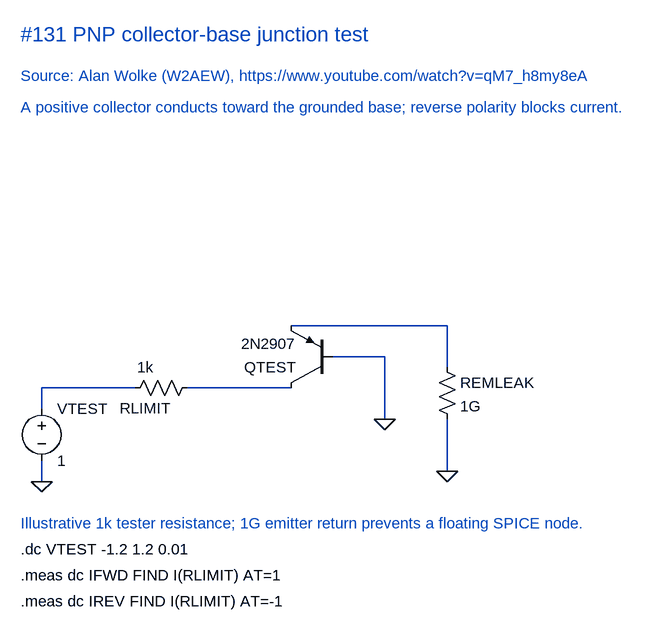
[diagram p0: schematic PNP base-collector test.asc]
PNP base-collector test.asc, the LTspice schematic file:
Version 4.1
SHEET 1 1088 960
WIRE 720 480 480 480
WIRE 624 528 544 528
WIRE 720 544 720 480
WIRE 240 576 96 576
WIRE 480 576 320 576
WIRE 96 608 96 576
WIRE 624 624 624 528
WIRE 720 704 720 624
WIRE 96 720 96 688
FLAG 96 720 0
FLAG 624 624 0
FLAG 720 704 0
SYMBOL voltage 96 592 R0
SYMATTR InstName VTEST
SYMATTR Value 1
SYMBOL res 224 592 R270
WINDOW 0 0 32 VBottom 2
WINDOW 3 32 32 VTop 2
SYMATTR InstName RLIMIT
SYMATTR Value 1k
SYMBOL pnp 544 576 R180
SYMATTR InstName QTEST
SYMATTR Value 2N2907
SYMBOL res 704 528 R0
SYMATTR InstName REMLEAK
SYMATTR Value 1G
TEXT 64 32 Left 3 ;#131 PNP collector-base junction test
TEXT 64 96 Left 2 ;Source: Alan Wolke (W2AEW), https://www.youtube.com/watch?v=qM7_h8my8eA
TEXT 64 144 Left 2 ;A positive collector conducts toward the grounded base; reverse polarity blocks current.
TEXT 64 784 Left 2 ;Illustrative 1k tester resistance; 1G emitter return prevents a floating SPICE node.
TEXT 64 824 Left 2 !.dc VTEST -1.2 1.2 0.01
TEXT 64 864 Left 2 !.meas dc IFWD FIND I(RLIMIT) AT=1
TEXT 64 904 Left 2 !.meas dc IREV FIND I(RLIMIT) AT=-1

The netlist it stands for:
* PNP base-collector test.asc
VTEST N002 0 1
RLIMIT N002 N003 1k
QTEST N003 0 N001 0 2N2907
REMLEAK N001 0 1G
.model NPN NPN
.model PNP PNP
.lib standard.bjt
* #131 PNP collector-base junction test
* Source: Alan Wolke (W2AEW), https://www.youtube.com/watch?v=qM7_h8my8eA
* A positive collector conducts toward the grounded base; reverse polarity blocks current.
* Illustrative 1k tester resistance; 1G emitter return prevents a floating SPICE node.
.dc VTEST -1.2 1.2 0.01
.meas dc IFWD FIND I(RLIMIT) AT=1
.meas dc IREV FIND I(RLIMIT) AT=-1
.backanno
.end